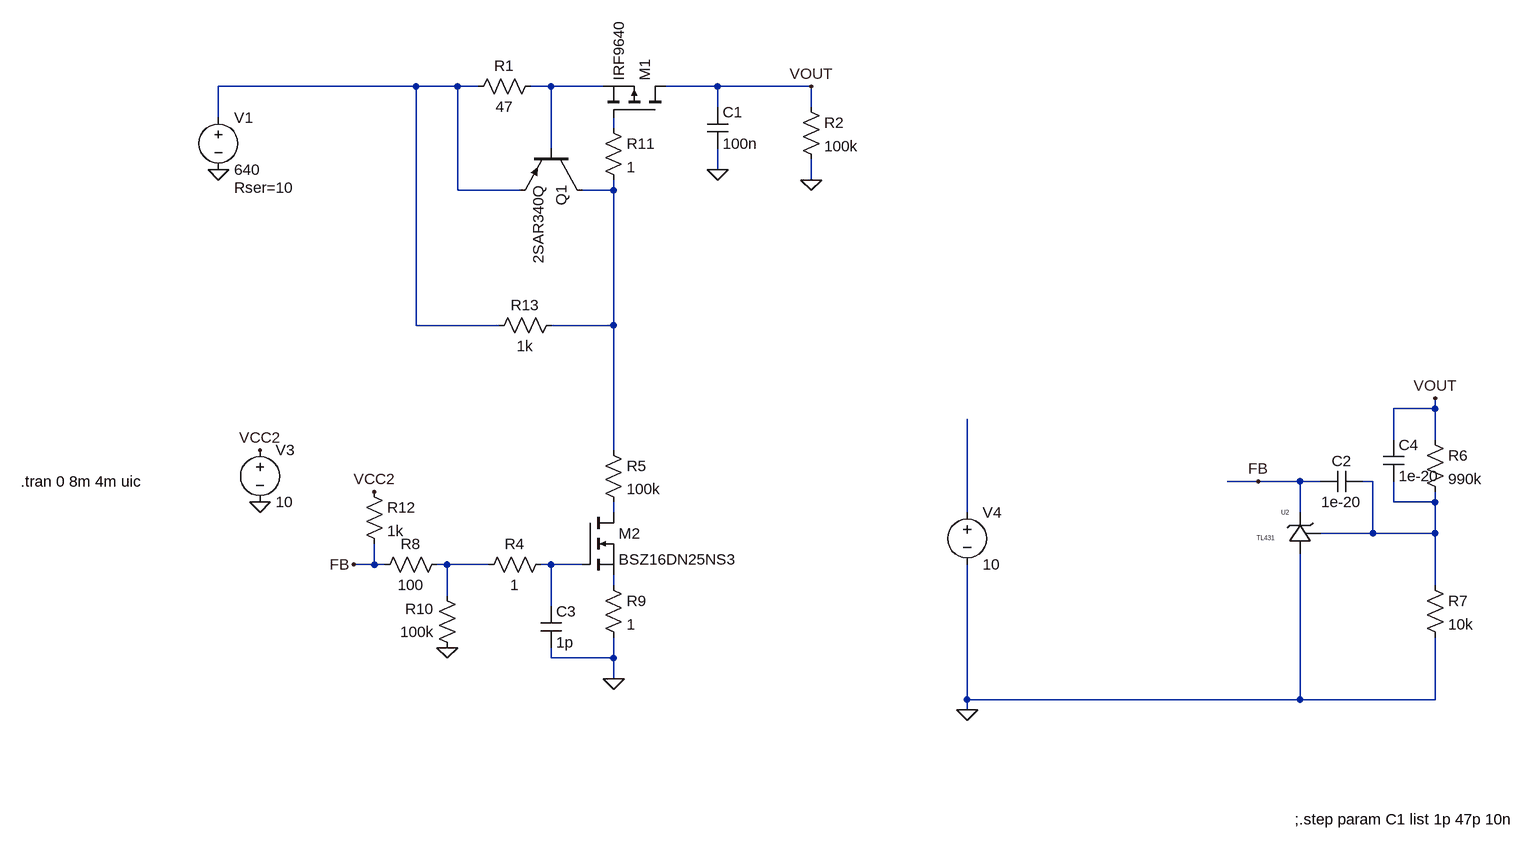
[diagram p0: schematic high_voltage_power_supply_pnp_tl431_no_opto.asc]
high_voltage_power_supply_pnp_tl431_no_opto.asc, the LTspice schematic file:
Version 4
SHEET 1 2548 1104
WIRE 352 -224 48 -224
WIRE 416 -224 352 -224
WIRE 448 -224 416 -224
WIRE 560 -224 528 -224
WIRE 640 -224 560 -224
WIRE 816 -224 736 -224
WIRE 960 -224 816 -224
WIRE 816 -192 816 -224
WIRE 960 -192 960 -224
WIRE 48 -176 48 -224
WIRE 656 -160 656 -176
WIRE 560 -128 560 -224
WIRE 816 -96 816 -128
WIRE 960 -80 960 -112
WIRE 416 -64 416 -224
WIRE 512 -64 416 -64
WIRE 656 -64 656 -80
WIRE 656 -64 608 -64
WIRE 352 144 352 -224
WIRE 480 144 352 144
WIRE 656 144 656 -64
WIRE 656 144 560 144
WIRE 1920 272 1920 256
WIRE 1920 272 1856 272
WIRE 1856 320 1856 272
WIRE 1920 320 1920 272
WIRE 656 336 656 144
WIRE 1648 384 1600 384
WIRE 1712 384 1648 384
WIRE 1744 384 1712 384
WIRE 1824 384 1808 384
WIRE 1856 416 1856 384
WIRE 1920 416 1920 400
WIRE 1920 416 1856 416
WIRE 656 432 656 416
WIRE 1200 432 1200 288
WIRE 1712 432 1712 384
WIRE 1824 464 1824 384
WIRE 1824 464 1744 464
WIRE 1920 464 1920 416
WIRE 1920 464 1824 464
WIRE 288 512 288 480
WIRE 288 512 256 512
WIRE 304 512 288 512
WIRE 400 512 384 512
WIRE 464 512 400 512
WIRE 560 512 544 512
WIRE 608 512 560 512
WIRE 656 544 656 528
WIRE 1920 544 1920 464
WIRE 400 560 400 512
WIRE 560 576 560 512
WIRE 560 656 560 640
WIRE 656 656 656 624
WIRE 656 656 560 656
WIRE 656 688 656 656
WIRE 1200 720 1200 512
WIRE 1712 720 1712 496
WIRE 1712 720 1200 720
WIRE 1920 720 1920 624
WIRE 1920 720 1712 720
WIRE 1200 736 1200 720
FLAG 48 -96 0
FLAG 816 -96 0
FLAG 960 -80 0
FLAG 960 -224 VOUT
FLAG 1920 256 VOUT
FLAG 1200 736 0
FLAG 256 512 FB
FLAG 656 688 0
FLAG 1648 384 FB
FLAG 112 416 0
FLAG 112 336 VCC2
FLAG 288 400 VCC2
FLAG 400 640 0
SYMBOL voltage 48 -192 R0
WINDOW 123 0 0 Left 0
WINDOW 39 24 124 Left 2
SYMATTR SpiceLine Rser=10
SYMATTR InstName V1
SYMATTR Value 640
SYMBOL res 432 -208 R270
WINDOW 0 32 56 VTop 2
WINDOW 3 0 56 VBottom 2
SYMATTR InstName R1
SYMATTR Value 47
SYMBOL cap 800 -192 R0
SYMATTR InstName C1
SYMATTR Value 100n
SYMATTR SpiceLine Rser=0.1
SYMBOL res 944 -208 R0
SYMATTR InstName R2
SYMATTR Value 100k
SYMBOL res 448 528 R270
WINDOW 0 32 56 VTop 2
WINDOW 3 0 56 VBottom 2
SYMATTR InstName R4
SYMATTR Value 1
SYMBOL res 640 320 R0
SYMATTR InstName R5
SYMATTR Value 100k
SYMBOL voltage 1200 416 R0
WINDOW 123 0 0 Left 0
WINDOW 39 24 124 Left 2
SYMATTR InstName V4
SYMATTR Value 10
SYMBOL res 1904 304 R0
SYMATTR InstName R6
SYMATTR Value 990k
SYMBOL res 1904 528 R0
SYMATTR InstName R7
SYMATTR Value 10k
SYMBOL cap 1808 368 R90
WINDOW 0 0 32 VBottom 2
WINDOW 3 32 32 VTop 2
SYMATTR InstName C2
SYMATTR Value 1e-20
SYMBOL cap 544 576 R0
SYMATTR InstName C3
SYMATTR Value 1p
SYMBOL pnp 608 -128 R90
SYMATTR InstName Q1
SYMATTR Value 2SAR340Q
SYMBOL res 640 528 R0
SYMATTR InstName R9
SYMATTR Value 1
SYMBOL cap 1840 320 R0
SYMATTR InstName C4
SYMATTR Value 1e-20
SYMBOL res 640 -176 R0
SYMATTR InstName R11
SYMATTR Value 1
SYMBOL TL431 1728 432 M0
SYMATTR InstName U2
SYMBOL voltage 112 320 R0
WINDOW 123 0 0 Left 0
WINDOW 39 0 0 Left 0
SYMATTR InstName V3
SYMATTR Value 10
SYMBOL res 272 384 R0
SYMATTR InstName R12
SYMATTR Value 1k
SYMBOL res 400 496 R90
WINDOW 0 0 56 VBottom 2
WINDOW 3 32 56 VTop 2
SYMATTR InstName R8
SYMATTR Value 100
SYMBOL res 416 656 R180
WINDOW 0 36 76 Left 2
WINDOW 3 36 40 Left 2
SYMATTR InstName R10
SYMATTR Value 100k
SYMBOL pmos 736 -176 M270
SYMATTR InstName M1
SYMATTR Value IRF9640
SYMBOL nmos 608 432 R0
SYMATTR InstName M2
SYMATTR Value BSZ16DN25NS3
SYMBOL res 576 128 R90
WINDOW 0 0 56 VBottom 2
WINDOW 3 32 56 VTop 2
SYMATTR InstName R13
SYMATTR Value 1k
TEXT -256 384 Left 2 !.tran 0 8m 4m uic
TEXT 1704 904 Left 2 !;.step param C1 list 1p 47p 10n

The netlist it stands for:
* high_voltage_power_supply_pnp_tl431_no_opto.asc
V1 N001 0 640 Rser=10
R1 N001 N002 47
C1 VOUT 0 100n Rser=0.1
R2 VOUT 0 100k
R4 N008 N009 1
R5 N004 N006 100k
V4 N007 0 10
R6 VOUT N005 990k
R7 N005 0 10k
C2 N005 FB 1e-20
C3 N009 0 1p
Q1 N004 N002 N001 0 2SAR340Q
R9 N010 0 1
C4 VOUT N005 1e-20
R11 N003 N004 1
XU2 0 FB N005 TL431  ; pins A K R
V3 VCC2 0 10
R12 VCC2 FB 1k
R8 N008 FB 100
R10 0 N008 100k
M1 VOUT N003 N002 N002 IRF9640
M2 N006 N009 N010 N010 BSZ16DN25NS3
R13 N004 N001 1k
.model NPN NPN
.model PNP PNP
.lib standard.bjt
.model NMOS NMOS
.model PMOS PMOS
.lib standard.mos
.tran 0 8m 4m uic
;.step param C1 list 1p 47p 10n
.lib TL431.lib
.backanno
.end